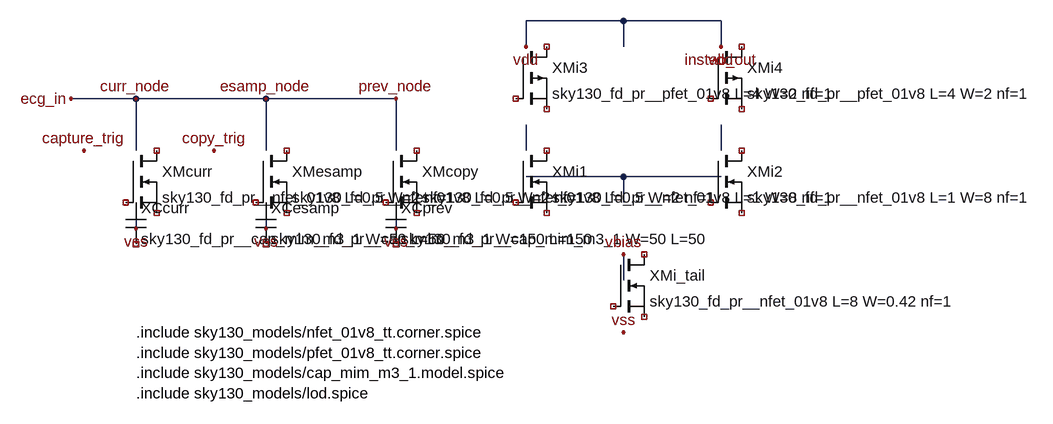
[diagram p0: schematic beat_instability_schematic_F3_4.asc]
beat_instability_schematic_F3_4.asc, the LTspice schematic file:
Version 4.1
SHEET 1 1400 900
WIRE -600 -120 -700 -120
WIRE -400 -120 -600 -120
WIRE -200 -120 -400 -120
WIRE -600 -40 -600 -120
WIRE -400 -40 -400 -120
WIRE -200 -40 -200 -120
WIRE -600 40 -600 80
WIRE -400 40 -400 80
WIRE -200 40 -200 80
WIRE 0 -200 0 -240
WIRE 0 -240 300 -240
WIRE 300 -240 300 -200
WIRE 150 -200 150 -240
WIRE 0 -40 0 -80
WIRE 300 -40 300 -80
WIRE 0 0 150 0
WIRE 300 0 150 0
WIRE 150 0 150 40
WIRE 150 120 150 160
FLAG -700 -120 ecg_in
FLAG -680 -40 capture_trig
FLAG -480 -40 copy_trig
FLAG -600 -120 curr_node
FLAG -400 -120 esamp_node
FLAG -200 -120 prev_node
FLAG 300 -200 instab_out
FLAG 0 -200 vdd
FLAG 300 -200 vdd
FLAG 150 240 vss
FLAG -600 80 vss
FLAG -400 80 vss
FLAG -200 80 vss
FLAG 150 120 vbias
SYMBOL nmos -616 -40 R0
SYMATTR InstName XMcurr
SYMATTR Value sky130_fd_pr__nfet_01v8 L=0.5 W=2 nf=1
SYMBOL cap -616 40 R0
SYMATTR InstName XCcurr
SYMATTR Value sky130_fd_pr__cap_mim_m3_1 W=50 L=50
SYMBOL nmos -416 -40 R0
SYMATTR InstName XMesamp
SYMATTR Value sky130_fd_pr__nfet_01v8 L=0.5 W=2 nf=1
SYMBOL cap -416 40 R0
SYMATTR InstName XCesamp
SYMATTR Value sky130_fd_pr__cap_mim_m3_1 W=150 L=150
SYMBOL nmos -216 -40 R0
SYMATTR InstName XMcopy
SYMATTR Value sky130_fd_pr__nfet_01v8 L=0.5 W=2 nf=1
SYMBOL cap -216 40 R0
SYMATTR InstName XCprev
SYMATTR Value sky130_fd_pr__cap_mim_m3_1 W=50 L=50
SYMBOL pmos -16 -200 R0
SYMATTR InstName XMi3
SYMATTR Value sky130_fd_pr__pfet_01v8 L=4 W=2 nf=1
SYMBOL pmos 284 -200 R0
SYMATTR InstName XMi4
SYMATTR Value sky130_fd_pr__pfet_01v8 L=4 W=2 nf=1
SYMBOL nmos -16 -40 R0
SYMATTR InstName XMi1
SYMATTR Value sky130_fd_pr__nfet_01v8 L=1 W=8 nf=1
SYMBOL nmos 284 -40 R0
SYMATTR InstName XMi2
SYMATTR Value sky130_fd_pr__nfet_01v8 L=1 W=8 nf=1
SYMBOL nmos 134 120 R0
SYMATTR InstName XMi_tail
SYMATTR Value sky130_fd_pr__nfet_01v8 L=8 W=0.42 nf=1
TEXT -600 240 Left 2 !.include sky130_models/nfet_01v8_tt.corner.spice\n.include sky130_models/pfet_01v8_tt.corner.spice\n.include sky130_models/cap_mim_m3_1.model.spice\n.include sky130_models/lod.spice

The netlist it stands for:
* beat_instability_schematic_F3_4.asc
* XMcurr: sky130_fd_pr__nfet_01v8 L=0.5 W=2 nf=1 (symbol nmos not certain, pin order unknown); nets seen at it: 
C§XCcurr vss NC_04 sky130_fd_pr__cap_mim_m3_1 W=50 L=50
* XMesamp: sky130_fd_pr__nfet_01v8 L=0.5 W=2 nf=1 (symbol nmos not certain, pin order unknown); nets seen at it: 
C§XCesamp vss NC_08 sky130_fd_pr__cap_mim_m3_1 W=150 L=150
* XMcopy: sky130_fd_pr__nfet_01v8 L=0.5 W=2 nf=1 (symbol nmos not certain, pin order unknown); nets seen at it: 
C§XCprev vss NC_12 sky130_fd_pr__cap_mim_m3_1 W=50 L=50
M§XMi3 NC_13 NC_14 NC_15 NC_15 sky130_fd_pr__pfet_01v8 L=4 W=2 nf=1
M§XMi4 NC_16 NC_17 NC_18 NC_18 sky130_fd_pr__pfet_01v8 L=4 W=2 nf=1
* XMi1: sky130_fd_pr__nfet_01v8 L=1 W=8 nf=1 (symbol nmos not certain, pin order unknown); nets seen at it: 
* XMi2: sky130_fd_pr__nfet_01v8 L=1 W=8 nf=1 (symbol nmos not certain, pin order unknown); nets seen at it: 
* XMi_tail: sky130_fd_pr__nfet_01v8 L=8 W=0.42 nf=1 (symbol nmos not certain, pin order unknown); nets seen at it: 
.model NMOS NMOS
.model PMOS PMOS
.lib standard.mos
.include sky130_models/nfet_01v8_tt.corner.spice
.include sky130_models/pfet_01v8_tt.corner.spice
.include sky130_models/cap_mim_m3_1.model.spice
.include sky130_models/lod.spice
.backanno
.end